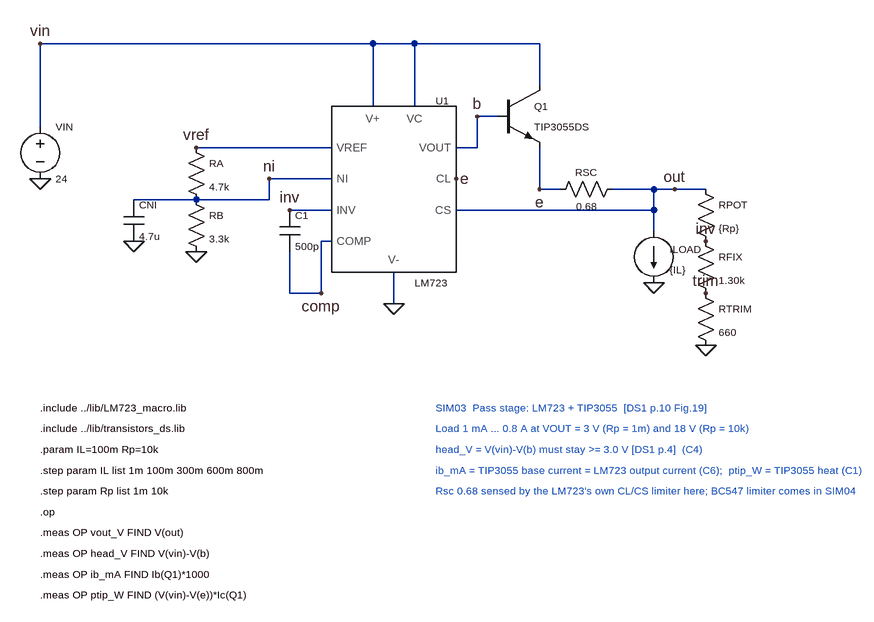
[diagram p0: schematic SIM03_pass_stage.asc]
SIM03_pass_stage.asc, the LTspice schematic file:
Version 4
SHEET 1 1500 1100
WIRE 96 304 96 176
WIRE 96 176 864 176
WIRE 608 176 608 272
WIRE 672 176 672 272
WIRE 864 176 864 240
WIRE 640 528 640 576
WIRE 544 336 336 336
WIRE 336 416 448 416
WIRE 448 416 448 384
WIRE 448 384 544 384
WIRE 240 416 336 416
WIRE 544 432 480 432
WIRE 544 480 528 480
WIRE 528 480 528 560
WIRE 528 560 480 560
WIRE 480 560 480 496
WIRE 736 336 768 336
WIRE 768 336 768 288
WIRE 768 288 800 288
WIRE 864 336 864 400
WIRE 864 400 896 400
WIRE 976 400 1120 400
WIRE 736 432 1040 432
WIRE 1040 432 1040 400
WIRE 1040 432 1040 464
FLAG 96 384 0
FLAG 640 576 0
FLAG 336 496 0
FLAG 240 480 0
FLAG 96 176 vin
FLAG 336 336 vref
FLAG 448 384 ni
FLAG 480 432 inv
FLAG 528 560 comp
FLAG 768 288 b
FLAG 736 384 e
FLAG 864 400 e
FLAG 1072 400 out
FLAG 1040 544 0
FLAG 1120 480 inv
FLAG 1120 560 trim
FLAG 1120 640 0
SYMBOL voltage 96 288 R0
WINDOW 0 24 16 Left 1
WINDOW 3 24 96 Left 1
SYMATTR InstName VIN
SYMATTR Value 24
SYMBOL LM723 640 400 R0
WINDOW 0 64 -136 Left 1
WINDOW 3 32 144 Left 1
SYMATTR InstName U1
SYMBOL npn 800 240 R0
WINDOW 0 56 32 Left 1
WINDOW 3 56 64 Left 1
SYMATTR InstName Q1
SYMATTR Value TIP3055DS
SYMBOL res 320 320 R0
WINDOW 0 36 40 Left 1
WINDOW 3 36 76 Left 1
SYMATTR InstName RA
SYMATTR Value 4.7k
SYMBOL res 320 400 R0
WINDOW 0 36 40 Left 1
WINDOW 3 36 76 Left 1
SYMATTR InstName RB
SYMATTR Value 3.3k
SYMBOL cap 224 416 R0
WINDOW 0 24 8 Left 1
WINDOW 3 24 56 Left 1
SYMATTR InstName CNI
SYMATTR Value 4.7u
SYMBOL cap 464 432 R0
WINDOW 0 24 8 Left 1
WINDOW 3 24 56 Left 1
SYMATTR InstName C1
SYMATTR Value 500p
SYMBOL res 992 384 R90
WINDOW 0 0 56 VBottom 1
WINDOW 3 32 56 VTop 1
SYMATTR InstName RSC
SYMATTR Value 0.68
SYMBOL current 1040 464 R0
WINDOW 0 24 28 Left 1
WINDOW 3 24 60 Left 1
SYMATTR InstName ILOAD
SYMATTR Value {IL}
SYMBOL res 1104 384 R0
WINDOW 0 36 40 Left 1
WINDOW 3 36 76 Left 1
SYMATTR InstName RPOT
SYMATTR Value {Rp}
SYMBOL res 1104 464 R0
WINDOW 0 36 40 Left 1
WINDOW 3 36 76 Left 1
SYMATTR InstName RFIX
SYMATTR Value 1.30k
SYMBOL res 1104 544 R0
WINDOW 0 36 40 Left 1
WINDOW 3 36 76 Left 1
SYMATTR InstName RTRIM
SYMATTR Value 660
TEXT 96 736 Left 1 !.include ../lib/LM723_macro.lib
TEXT 96 768 Left 1 !.include ../lib/transistors_ds.lib
TEXT 96 800 Left 1 !.param IL=100m Rp=10k
TEXT 96 832 Left 1 !.step param IL list 1m 100m 300m 600m 800m
TEXT 96 864 Left 1 !.step param Rp list 1m 10k
TEXT 96 896 Left 1 !.op
TEXT 96 928 Left 1 !.meas OP vout_V FIND V(out)
TEXT 96 960 Left 1 !.meas OP head_V FIND V(vin)-V(b)
TEXT 96 992 Left 1 !.meas OP ib_mA FIND Ib(Q1)*1000
TEXT 96 1024 Left 1 !.meas OP ptip_W FIND (V(vin)-V(e))*Ic(Q1)
TEXT 704 736 Left 1 ;SIM03  Pass stage: LM723 + TIP3055  [DS1 p.10 Fig.19]
TEXT 704 768 Left 1 ;Load 1 mA ... 0.8 A at VOUT = 3 V (Rp = 1m) and 18 V (Rp = 10k)
TEXT 704 800 Left 1 ;head_V = V(vin)-V(b) must stay >= 3.0 V [DS1 p.4]  (C4)
TEXT 704 832 Left 1 ;ib_mA = TIP3055 base current = LM723 output current (C6);  ptip_W = TIP3055 heat (C1)
TEXT 704 864 Left 1 ;Rsc 0.68 sensed by the LM723's own CL/CS limiter here; BC547 limiter comes in SIM04

The netlist it stands for:
* SIM03_pass_stage.asc
VIN vin 0 24
XU1 vin 0 vin b vref ni inv comp e out LM723  ; pins V+ V- VC VOUT VREF NI INV COMP CL CS
Q1 vin b e 0 TIP3055DS
RA vref ni 4.7k
RB ni 0 3.3k
CNI ni 0 4.7u
C1 inv comp 500p
RSC out e 0.68
ILOAD out 0 {IL}
RPOT out inv {Rp}
RFIX inv trim 1.30k
RTRIM trim 0 660
.model NPN NPN
.model PNP PNP
.lib standard.bjt
.include ../lib/LM723_macro.lib
.include ../lib/transistors_ds.lib
.param IL=100m Rp=10k
.step param IL list 1m 100m 300m 600m 800m
.step param Rp list 1m 10k
.op
.meas OP vout_V FIND V(out)
.meas OP head_V FIND V(vin)-V(b)
.meas OP ib_mA FIND Ib(Q1)*1000
.meas OP ptip_W FIND (V(vin)-V(e))*Ic(Q1)
* SIM03  Pass stage: LM723 + TIP3055  [DS1 p.10 Fig.19]
* Load 1 mA ... 0.8 A at VOUT = 3 V (Rp = 1m) and 18 V (Rp = 10k)
* head_V = V(vin)-V(b) must stay >= 3.0 V [DS1 p.4]  (C4)
* ib_mA = TIP3055 base current = LM723 output current (C6);  ptip_W = TIP3055 heat (C1)
* Rsc 0.68 sensed by the LM723's own CL/CS limiter here; BC547 limiter comes in SIM04
.backanno
.end